# Altium schematic sheet A2_next.SchDoc
size 594 x 420 mm; DocumentNumber: Введите номер платы + Э3; SheetNumber: номер страницы; Format: A2
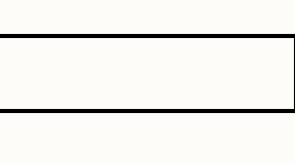
[diagram p0: A2_next.SchDoc, top left]
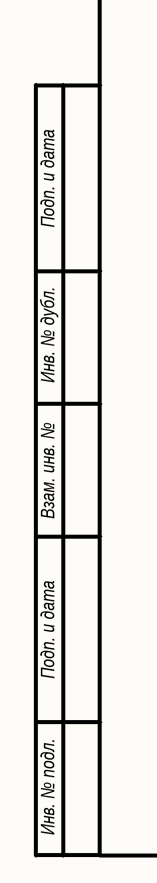
[diagram p1: A2_next.SchDoc, bottom left]
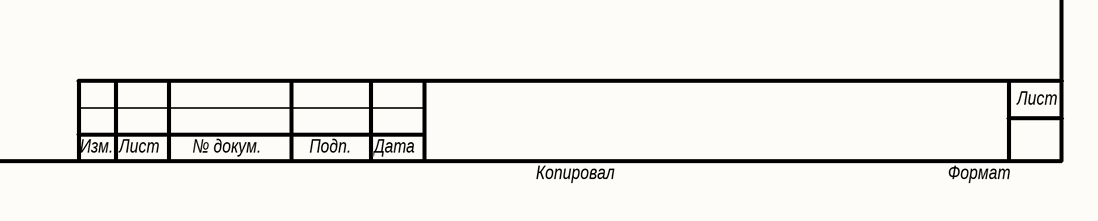
[diagram p2: A2_next.SchDoc, bottom right]

## Notes on the sheet
- Подп. и дата
- Инв. № дубл.
- Взам. инв. №
- Инв. № подл.
- Лист
- Изм.
- № докум.
- Подп.
- Дата
- Копировал
- Формат